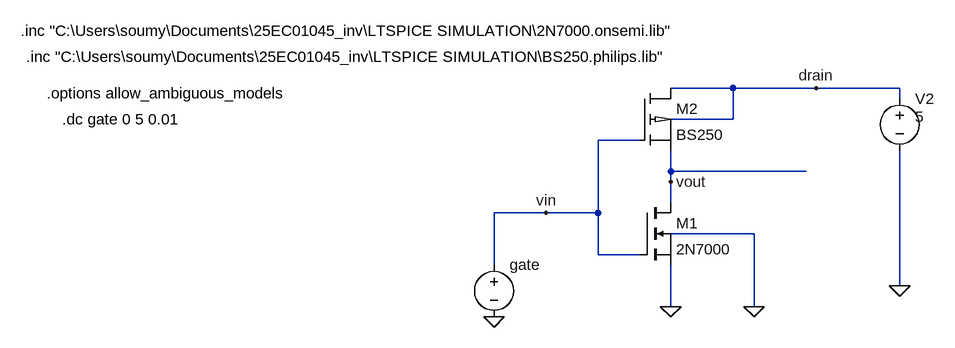
[diagram p0: schematic ltspice_simulation.asc]
ltspice_simulation.asc, the LTspice schematic file:
Version 4.1
SHEET 1 880 680
WIRE 272 -80 176 -80
WIRE 400 -80 272 -80
WIRE 528 -80 400 -80
WIRE 528 -64 528 -80
WIRE 272 -32 272 -80
WIRE 272 -32 176 -32
WIRE 128 0 64 0
WIRE 176 48 176 16
WIRE 384 48 176 48
WIRE 176 64 176 48
WIRE 176 96 176 64
WIRE -16 112 -96 112
WIRE 64 112 64 0
WIRE 64 112 -16 112
WIRE 304 144 176 144
WIRE 64 176 64 112
WIRE 128 176 64 176
WIRE -96 192 -96 112
WIRE 528 224 528 16
WIRE 176 256 176 192
WIRE 304 256 304 144
FLAG 176 256 0
FLAG 304 256 0
FLAG 528 224 0
FLAG 400 -80 drain
FLAG -16 112 vin
FLAG 176 64 vout
FLAG -96 272 0
SYMBOL voltage 528 -80 R0
WINDOW 3 24 44 Left 2
WINDOW 123 0 0 Left 0
WINDOW 39 0 0 Left 0
SYMATTR Value 5
SYMATTR InstName V2
SYMBOL voltage -96 176 R0
WINDOW 123 0 0 Left 0
WINDOW 39 0 0 Left 0
SYMATTR InstName gate
SYMATTR Value ""
SYMBOL nmos 128 96 R0
SYMATTR InstName M1
SYMATTR Value 2N7000
SYMATTR Prefix X
SYMBOL pmos 128 -80 R0
SYMATTR InstName M2
SYMATTR Value BS250
SYMATTR Prefix X
TEXT -784 -72 Left 2 !.options allow_ambiguous_models
TEXT -760 -32 Left 2 !.dc gate 0 5 0.01
TEXT -824 -168 Left 2 !.inc "C:\\Users\\soumy\\Documents\\25EC01045_inv\\LTSPICE SIMULATION\\2N7000.onsemi.lib"
TEXT -816 -128 Left 2 !.inc "C:\\Users\\soumy\\Documents\\25EC01045_inv\\LTSPICE SIMULATION\\BS250.philips.lib"

The netlist it stands for:
* ltspice_simulation.asc
V2 drain 0 5
V§gate vin 0
X§M1 vout vin 0 2N7000  ; pins D G S
X§M2 vout vin drain BS250  ; pins D G S
.options allow_ambiguous_models
.dc gate 0 5 0.01
.inc "C:\Users\soumy\Documents\25EC01045_inv\LTSPICE SIMULATION\2N7000.onsemi.lib"
.inc "C:\Users\soumy\Documents\25EC01045_inv\LTSPICE SIMULATION\BS250.philips.lib"
.backanno
.end